# Altium schematic sheet Isolator_Section.SchDoc
size A; DocumentNumber: 5; SheetNumber: 5; SheetTotal: 8
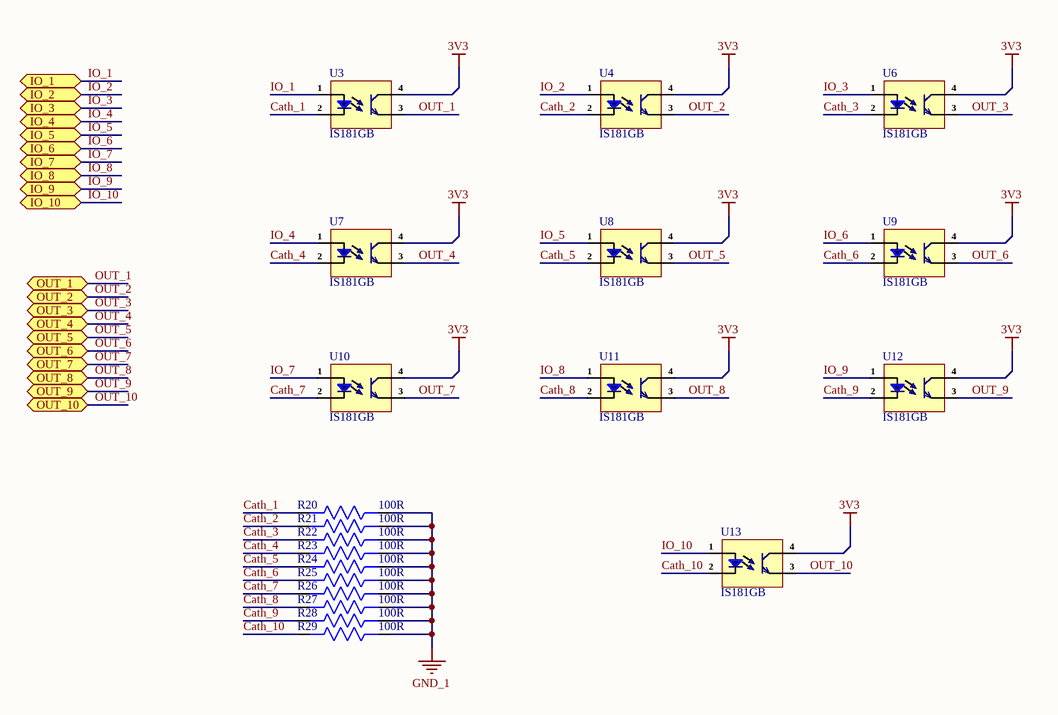
[diagram p0: Isolator_Section.SchDoc]

## Parts
R20  100R  [Res-0402]
R21  100R  [Res-0402]
R22  100R  [Res-0402]
R23  100R  [Res-0402]
R24  100R  [Res-0402]
R25  100R  [Res-0402]
R26  100R  [Res-0402]
R27  100R  [Res-0402]
R28  100R  [Res-0402]
R29  100R  [Res-0402]
U3  IS181GB  [SOP-4_2.54]
U4  IS181GB  [SOP-4_2.54]
U6  IS181GB  [SOP-4_2.54]
U7  IS181GB  [SOP-4_2.54]
U8  IS181GB  [SOP-4_2.54]
U9  IS181GB  [SOP-4_2.54]
U10  IS181GB  [SOP-4_2.54]
U11  IS181GB  [SOP-4_2.54]
U12  IS181GB  [SOP-4_2.54]
U13  IS181GB  [SOP-4_2.54]

## Ports
IO_1 (bidir), IO_2 (bidir), IO_3 (bidir), IO_4 (bidir), IO_5 (bidir), IO_6 (bidir), IO_7 (bidir), IO_8 (bidir), IO_9 (bidir), IO_10 (bidir), OUT_1 (bidir), OUT_2 (bidir), OUT_3 (bidir), OUT_4 (bidir), OUT_5 (bidir), OUT_6 (bidir), OUT_7 (bidir), OUT_8 (bidir), OUT_9 (bidir), OUT_10 (bidir)

## Nets
3V3: U3.4(C) U4.4(C) U6.4(C) U7.4(C) U8.4(C) U9.4(C) U10.4(C) U11.4(C) U12.4(C) U13.4(C)
GND_1: R20.1 R21.1 R22.1 R23.1 R24.1 R25.1 R26.1 R27.1 R28.1 R29.1
Cath_1: R20.2 U3.2(Ca)
Cath_2: R21.2 U4.2(Ca)
Cath_3: R22.2 U6.2(Ca)
Cath_4: R23.2 U7.2(Ca)
Cath_5: R24.2 U8.2(Ca)
Cath_6: R25.2 U9.2(Ca)
Cath_7: R26.2 U10.2(Ca)
Cath_8: R27.2 U11.2(Ca)
Cath_9: R28.2 U12.2(Ca)
Cath_10: R29.2 U13.2(Ca)
IO_1: U3.1(An) ; port IO_1
IO_2: U4.1(An) ; port IO_2
IO_3: U6.1(An) ; port IO_3
IO_4: U7.1(An) ; port IO_4
IO_5: U8.1(An) ; port IO_5
IO_6: U9.1(An) ; port IO_6
IO_7: U10.1(An) ; port IO_7
IO_8: U11.1(An) ; port IO_8
IO_9: U12.1(An) ; port IO_9
IO_10: U13.1(An) ; port IO_10
OUT_1: U3.3(E) ; port OUT_1
OUT_2: U4.3(E) ; port OUT_2
OUT_3: U6.3(E) ; port OUT_3
OUT_4: U7.3(E) ; port OUT_4
OUT_5: U8.3(E) ; port OUT_5
OUT_6: U9.3(E) ; port OUT_6
OUT_7: U10.3(E) ; port OUT_7
OUT_8: U11.3(E) ; port OUT_8
OUT_9: U12.3(E) ; port OUT_9
OUT_10: U13.3(E) ; port OUT_10

## Library data of the parts
R20-R29 = RC0402FR-07100RL: RES 100 OHM 1% 1/16W 0402; Manufacturer: Yageo; Power Rating: 62.5mW; Voltage Rating: 50V; Temperature Coefficient: 100ppm/°C; Max Power Dissipation: 63mW; Supplier 1: Mouser; Manufacturer Part Number: RC0402FR-07100RL; RoHS: Yes; Category: Chip SMD Resistors; Stock 1: 699545; Pricing 1: 1=0.10000, 10=0.01200, 50=0.01200, 100=0.00500, 1000=0.00300, 2500=0.00200, 10000=0.00100 (USD); Case/Package: 0402; Number of Pins: 2; Case Code (Imperial): 0402; Case Code (Metric): 1005; Size Code: 0402; Min Operating Temperature: -55°C; Max Operating Temperature: 155°C; Tolerance: 1%; Voltage Rating (DC): 50V; Resistance: 100R; Packaging: Tape and Reel; Termination: SMD/SMT; Resistor Type: Thick Film; Features: Moisture Resistant; Series: RC; Number of Terminations: 2; Resistance Tolerance: 1%; Construction: Rectangular; Technology: THICK FILM; Length: 1mm; Width: 0.5mm; Height: 0.32mm; Depth: 0.5mm; RoHS Compliant: Yes; REACH SVHC: No SVHC; Military Standard: Not; Lead Free: Lead Free; ComponentLink1URL: https://datasheet.ciiva.com/11808/0900766b80c66297-11808765.pdf?src-supplier=RSComponents; ComponentLink1Description: https://datasheet.ciiva.com/11808/0900766b80c66297-11808765.pdf?src-supplier=RSComponents; ComponentLink2URL: https://datasheet.ciiva.com/7849/1784430-7849810.pdf?src-supplier=Element14; ComponentLink2Description: https://datasheet.ciiva.com/7849/1784430-7849810.pdf?src-supplier=Element14; ComponentLink3URL: https://datasheet.ciiva.com/28367/1018594-28367226.pdf?src-supplier=Element14; ComponentLink3Description: https://datasheet.ciiva.com/28367/1018594-28367226.pdf?src-supplier=Element14; ComponentLink4URL: https://datasheet.ciiva.com/22747/1018594-22747511.pdf?src-supplier=Element14; ComponentLink4Description: https://datasheet.ciiva.com/22747/1018594-22747511.pdf?src-supplier=Element14; ComponentLink5URL: https://datasheet.ciiva.com/12667/pyu-rc0402-51-rohs-l-6-r-12667957.pdf?src-supplier=Mouser; ComponentLink5Description: https://datasheet.ciiva.com/12667/pyu-rc0402-51-rohs-l-6-r-12667957.pdf?src-supplier=Mouser; ComponentLink6URL: https://datasheet.ciiva.com/15189/getdatasheetpartid-329466-15189335.pdf?src-supplier=Verical; ComponentLink6Description: https://datasheet.ciiva.com/15189/getdatasheetpartid-329466-15189335.pdf?src-supplier=Verical; ComponentLink7URL: https://datasheet.ciiva.com/16740/pyu-rc0402-51-rohs-l-6-r-16740566.pdf?src-supplier=Future+Electronics; ComponentLink7Description: https://datasheet.ciiva.com/16740/pyu-rc0402-51-rohs-l-6-r-16740566.pdf?src-supplier=Future+Electronics; Supplier Part Number 1: 603-RC0402FR-07100RL; LCSC Part Number: C106232
U3 U4 U6-U13 = IS181GB: Optoisolator Transistor Output 3750Vrms 1 Channel; Manufacturer: Isocom; Forward Current: 50mA; Reverse Breakdown Voltage: 6V; Isolation Voltage: 3.75kV; Rise Time: 18000ns; Power Dissipation: 170mW; Number of Elements: 1; Collector Emitter Saturation Voltage: 200mV; Forward Voltage: 1.4V; Collector Emitter Voltage (VCEO): 80V; Current Transfer Ratio: 600%; Item Type: Optocoupler; Supplier 1: Arrow Electronics; Manufacturer Part Number: IS181GB; RoHS: Yes; Category: Optocouplers; Stock 1: 2922; Pricing 1: 1=0.55080, 10=0.34190, 25=0.33860, 50=0.33530, 100=0.19360, 250=0.19160, 500=0.18960, 1000=0.14750 (USD); Mount: Surface Mount; Case/Package: SMD/SMT; Number of Pins: 4; Min Operating Temperature: -55°C; Max Operating Temperature: 100°C; Fall Time: 18000ns; Radiation Hardening: No; Lead Free: Lead Free; RoHS Compliant: Yes; ComponentLink1URL: https://datasheet.ciiva.com/26895/getdatasheetpartid-624485-26895717.pdf?src-supplier=Verical; ComponentLink1Description: https://datasheet.ciiva.com/26895/getdatasheetpartid-624485-26895717.pdf?src-supplier=Verical; ComponentLink2URL: https://datasheet.ciiva.com/29301/183289-da-01-en-optokoppler-is181-gb-29301106.pdf?src-supplier=Conrad; ComponentLink2Description: https://datasheet.ciiva.com/29301/183289-da-01-en-optokoppler-is181-gb-29301106.pdf?src-supplier=Conrad; Supplier Part Number 1: IS181GB; LCSC Part Number: C84196